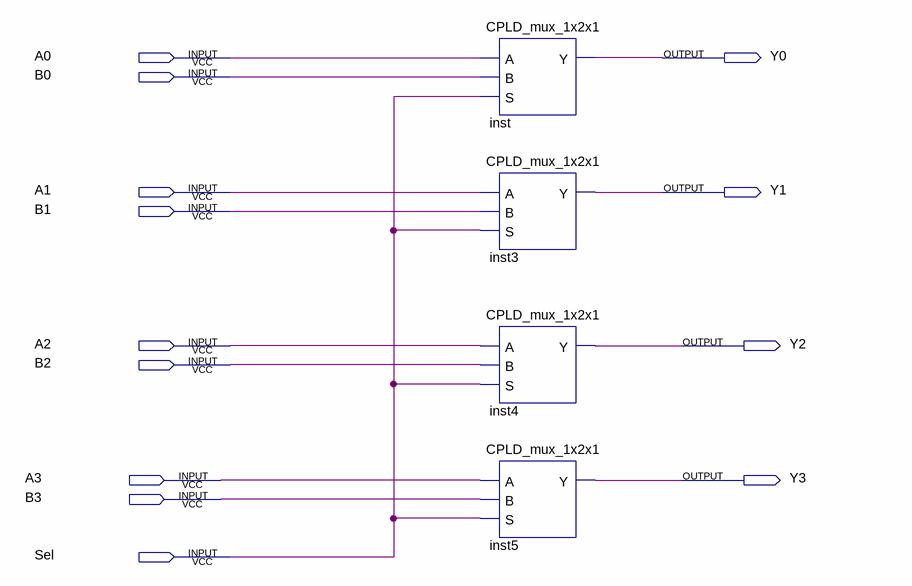
[diagram p0: schematic sheet]
// Quartus schematic CPLD_mux_4x2x4.bdf as structural Verilog: 4 symbols, 13 pins
module CPLD_mux_4x2x4 (
  input  A0,
  input  B0,
  input  A1,
  input  B1,
  input  A2,
  input  B2,
  input  A3,
  input  B3,
  input  Sel,
  output Y0,
  output Y1,
  output Y2,
  output Y3
);

  CPLD_mux_1x2x1 inst (.A(A0), .B(B0), .S(Sel), .Y(Y0));
  CPLD_mux_1x2x1 inst3 (.A(A1), .B(B1), .S(Sel), .Y(Y1));
  CPLD_mux_1x2x1 inst4 (.A(A2), .B(B2), .S(Sel), .Y(Y2));
  CPLD_mux_1x2x1 inst5 (.A(A3), .B(B3), .S(Sel), .Y(Y3));
endmodule
